# Altium project A_Board_Weather.Station.PrjPcb (part 1 of 2)
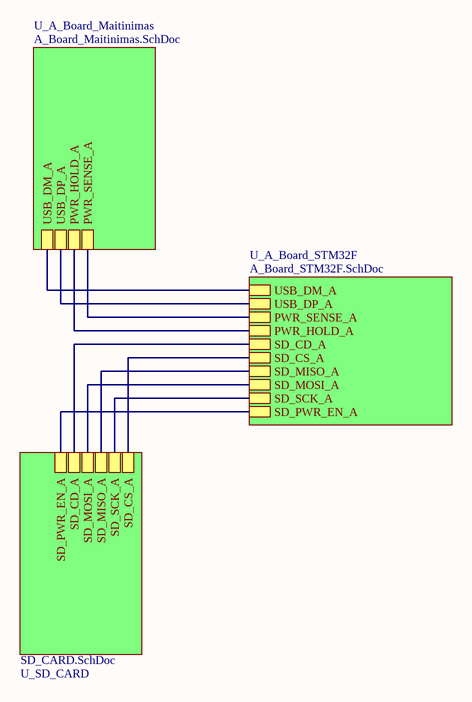
[diagram p0: A_top.SchDoc]
4 sheets, 136 parts. Net scope: hierarchical (ports join the sheet entries above them; power ports are global).
Sheets:
  A_top.SchDoc
    U_A_Board_Maitinimas = A_Board_Maitinimas.SchDoc
    U_A_Board_STM32F = A_Board_STM32F.SchDoc
    U_SD_CARD = SD_CARD.SchDoc

## Sheet A_top.SchDoc
size A4; SheetNumber: 1; SheetTotal: 4

### Sub-sheets
U_A_Board_Maitinimas = A_Board_Maitinimas.SchDoc: USB_DM_A, USB_DP_A, PWR_HOLD_A, PWR_SENSE_A
U_A_Board_STM32F = A_Board_STM32F.SchDoc: USB_DM_A, USB_DP_A, PWR_SENSE_A, PWR_HOLD_A, SD_CD_A, SD_CS_A, SD_MISO_A, SD_MOSI_A, SD_SCK_A, SD_PWR_EN_A
U_SD_CARD = SD_CARD.SchDoc: SD_CS_A, SD_SCK_A, SD_MISO_A, SD_MOSI_A, SD_CD_A, SD_PWR_EN_A

### Nets
PWR_HOLD_A: sheet U_A_Board_Maitinimas/PWR_HOLD_A, sheet U_A_Board_STM32F/PWR_HOLD_A
PWR_SENSE_A: sheet U_A_Board_Maitinimas/PWR_SENSE_A, sheet U_A_Board_STM32F/PWR_SENSE_A
SD_CD_A: sheet U_A_Board_STM32F/SD_CD_A, sheet U_SD_CARD/SD_CD_A
SD_CS_A: sheet U_A_Board_STM32F/SD_CS_A, sheet U_SD_CARD/SD_CS_A
SD_MISO_A: sheet U_A_Board_STM32F/SD_MISO_A, sheet U_SD_CARD/SD_MISO_A
SD_MOSI_A: sheet U_A_Board_STM32F/SD_MOSI_A, sheet U_SD_CARD/SD_MOSI_A
SD_PWR_EN_A: sheet U_A_Board_STM32F/SD_PWR_EN_A, sheet U_SD_CARD/SD_PWR_EN_A
SD_SCK_A: sheet U_A_Board_STM32F/SD_SCK_A, sheet U_SD_CARD/SD_SCK_A
NetIC3_4: sheet U_A_Board_Maitinimas/USB_DM_A, sheet U_A_Board_STM32F/USB_DM_A
NetIC3_6: sheet U_A_Board_Maitinimas/USB_DP_A, sheet U_A_Board_STM32F/USB_DP_A

## Sheet A_Board_Maitinimas.SchDoc
size A3; SheetNumber: 3; SheetTotal: 4
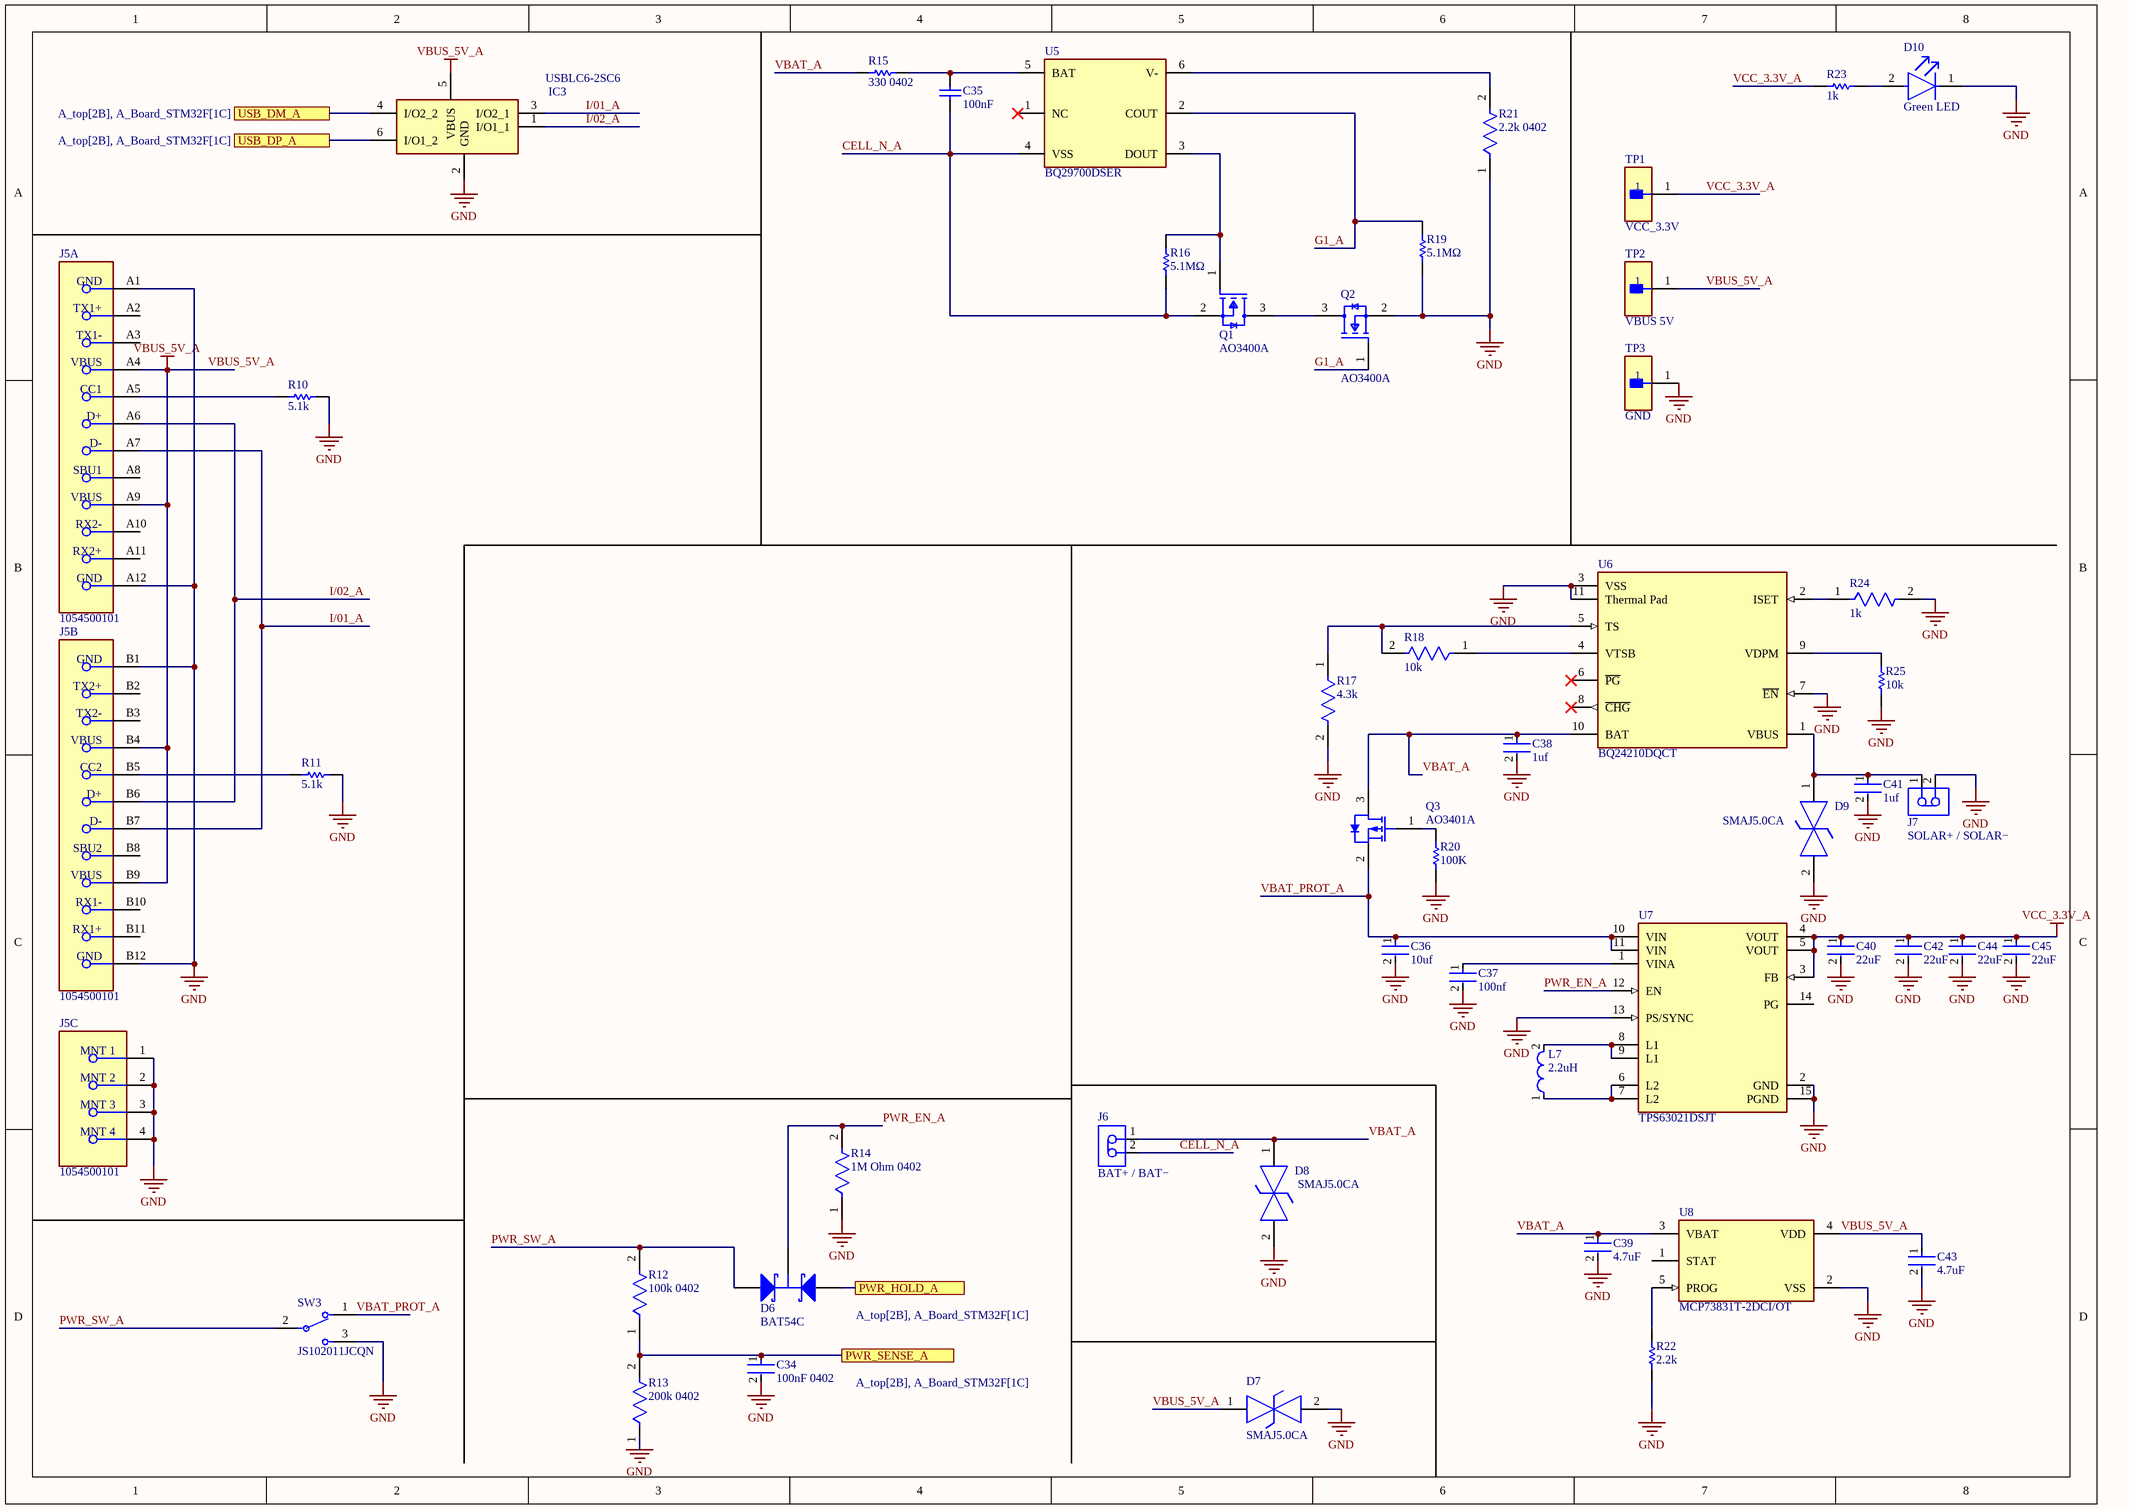
[diagram p1: A_Board_Maitinimas.SchDoc]

### Parts
C34  100nF 0402  [FP-CL17-IPC_C]
C35  100nF  [CAPC1608X90X35NL15T15]
C36  10uf  [FP-CL05A106MP5NUNC-MFG]
C37  100nf  [FP-0402B104K500CT-IPC_C]
C38  1uf  [FP-CL858-IPC_C]
C39  4.7uF  [FP-CL21-IPC_A]
C40  22uF  [FP-GRM21B-0_15-IPC_C]
C41  1uf  [FP-CL858-IPC_C]
C42  22uF  [FP-GRM21B-0_15-IPC_C]
C43  4.7uF  [FP-CL21-IPC_A]
C44  22uF  [FP-GRM21B-0_15-IPC_C]
C45  22uF  [FP-GRM21B-0_15-IPC_C]
D6  BAT54C  [NXP-SOT23-3_V]
D7  SMAJ5.0CA  [FP-SMAJ-MFG]
D8  SMAJ5.0CA  [FP-SMAJ-MFG]
D9  SMAJ5.0CA  [FP-SMAJ-MFG]
D10  Green LED  [FP-LTST-C171GKT-MFG]
IC3  USBLC6-2SC6  [SOT95P280X145-6N]
J5  1054500101  [FP-1054500101-MFG]  (parts A,B,C of 3)
J6  BAT+ / BAT−  [JST-B2B-PH-K-S_V]
J7  SOLAR+ / SOLAR−  [JST-B2B-PH-K-S_V]
L7  2.2uH  [FP-MLP2016M-MFG]
Q1  AO3400A  [FP-SOT23-MFG]
Q2  AO3400A  [FP-SOT23-MFG]
Q3  AO3401A  [AO-SOT-23-3L_V]
R10  5.1k  [RESC1005X40X25ML10T10]
R11  5.1k  [RESC1005X40X25ML10T10]
R12  100k 0402  [FP-CRGCQ0402-IPC_C]
R13  200k 0402  [FP-CRCW0402-e3-IPC_B]
R14  1M Ohm 0402  [FP-CRGCQ0402-IPC_C]
R15  330 0402  [RESC1005X40X25NL10T10]
R16  5.1MΩ  [RESC1005X40X25ML05T05]
R17  4.3k  [FP-RN73R1E-MFG]
R18  10k  [FP-AC0603-IPC_A]
R19  5.1MΩ  [RESC1005X40X25ML05T05]
R20  100K  [RESC1812(4532)_L]
R21  2.2k 0402  [FP-ESR01-IPC_B]
R22  2.2k  [RESC1005X40X25NL10T10]
R23  1k  [RESC1005X40X25ML10T10]
R24  1k  [FP-TFCR0805-MFG]
R25  10k  [RESC3225X60X45NL20T20]
SW3  JS102011JCQN  [FP-JS102011JCQN-MFG]
TP1  VCC_3.3V  [FP-5015-MFG]
TP2  VBUS 5V  [FP-5015-MFG]
TP3  GND  [FP-5015-MFG]
U5  BQ29700DSER  [FP-DSE0006A-IPC_B]
U6  BQ24210DQCT  [FP-DQC0010A-MFG]
U7  TPS63021DSJT  [FP-DSJ0014A-MFG]
U8  MCP73831T-2DCI/OT  [FP-C04-091-OT-IPC_B]

### Ports
PWR_HOLD_A (see A_top[2B], A_Board_STM32F[1C]), PWR_SENSE_A (see A_top[2B], A_Board_STM32F[1C]), USB_DM_A (see A_top[2B], A_Board_STM32F[1C]), USB_DP_A (see A_top[2B], A_Board_STM32F[1C])

### Nets
GND: C34.2 C36.2 C37.2 C38.2 C39.2 C40.2 C41.2 C42.2 C43.2 C44.2 C45.2 D7.2 D8.2 D9.2 D10.1(C) IC3.2(GND) J5.1(MNT_1) J5.2(MNT_2) J5.3(MNT_3) J5.4(MNT_4) J5.A1(GND) J5.A12(GND) J5.B1(GND) J5.B12(GND) J7.2 Q2.2(S) R10.2 R11.2 R13.1 R14.1 R17.2 R19.1 R20.2 R21.1 R22.1 R24.2 R25.1 SW3.3 TP3.1 U6.3(VSS) U6.7(~{EN}) U6.11(Thermal_Pad) U7.2(GND) U7.13(PS/SYNC) U7.15(PGND) U8.2(VSS)
VBUS_5V_A: C43.1 D7.1 IC3.5(VBUS) J5.A4(VBUS) J5.A9(VBUS) J5.B4(VBUS) J5.B9(VBUS) TP2.1 U8.4(VDD)
VCC_3.3V_A: C40.1 C42.1 C44.1 C45.1 R23.1 TP1.1 U7.3(FB) U7.4(VOUT) U7.5(VOUT)
CELL_N_A: C35.1 J6.2 Q1.2(S) R16.1 U5.4(VSS)
G1_A: Q2.1(G) R19.2 U5.2(COUT)
I/01_A: IC3.3(I/O2_1) J5.A7(D-) J5.B7(D-)
I/02_A: IC3.1(I/O1_1) J5.A6(D+) J5.B6(D+)
PWR_EN_A: D6.3(K) R14.2 U7.12(EN)
PWR_HOLD_A: D6.2(A) ; port PWR_HOLD_A
PWR_SENSE_A: C34.1 R12.1 R13.2 ; port PWR_SENSE_A
PWR_SW_A: D6.1(A) R12.2 SW3.2
VBAT_A: C38.1 C39.1 D8.1 J6.1 Q3.3(DRAIN) R15.1 U6.10(BAT) U8.3(VBAT)
VBAT_PROT_A: C36.1 Q3.2(SOURCE) SW3.1 U7.10(VIN) U7.11(VIN)
NetC35_2: C35.2 R15.2 U5.5(BAT)
NetC37_1: C37.1 U7.1(VINA)
NetC41_1: C41.1 D9.1 J7.1 U6.1(VBUS)
NetD10_2: D10.2(A) R23.2
NetIC3_4: IC3.4(I/O2_2) ; port USB_DM_A
NetIC3_6: IC3.6(I/O1_2) ; port USB_DP_A
NetJ5_A5: J5.A5(CC1) R10.1
NetJ5_B5: J5.B5(CC2) R11.1
NetL7_1: L7.1 U7.6(L2) U7.7(L2)
NetL7_2: L7.2 U7.8(L1) U7.9(L1)
NetQ1_1: Q1.1(G) R16.2 U5.3(DOUT)
NetQ1_3: Q1.3(D) Q2.3(D)
NetQ3_1: Q3.1(GATE) R20.1
NetR17_1: R17.1 R18.2 U6.5(TS)
NetR18_1: R18.1 U6.4(VTSB)
NetR21_2: R21.2 U5.6(V-)
NetR22_2: R22.2 U8.5(PROG)
NetR24_1: R24.1 U6.2(ISET)
NetR25_2: R25.2 U6.9(VDPM)

Not connected (* = marked no-connect by the designer): J5 A2(TX1+) A3(TX1-) A8(SBU1) A10(RX2-) A11(RX2+) B2(TX2+) B3(TX2-) B8(SBU2) B10(RX1-) B11(RX1+); U5 1(NC)*; U6 6(~{PG})* 8(~{CHG})*; U7 14(PG); U8 1(STAT)

### Library data of the parts
C34 = CMP-13271-001069-1: Cap Ceramic 100nF 10V X7R ±10% SMD 0402 +125°C Paper T/R; Height: 0.5mm; Case/Package: 0402; Contact Plating: Tin; Case Code (Imperial): 0402; Capacitance: 100nF; Thickness: 0.022inch; Min Operating Temperature: -55°C; Package Quantity: 1; Length: 1mm; Max Operating Temperature: 125°C; Depth: 0.5mm; Voltage Rating: 10V; Packaging: Tape and Reel; Mount: Surface Mount; Tolerance: 10%; Width: 0.02inch; Radiation Hardening: No; Case Code (Metric): 1005; Dielectric: X7R
C35 = CMP-2006-02299-1: Part Number: C0603C104K4RAC7013; Manufacturer: Kemet
C36 = CMP-13271-000002-1: CAP CER 10UF 10V X5R 0402; Manufacturer Part Number: CL05A106MP5NUNC; Manufacturer: Samsung; Temperature Coefficient: 15%; Tolerance: 20%; Material: Ceramic; Octopart: https://octopart.com/cl05a106mp5nunc-samsung-22457395; Voltage Rating: 10V; RoHS: TRUE; Value: 10uF; Height: 0.7mm; Digikey Description: CAP CER 10UF 10V X5R 0402; Automotive: No; Package: CL05A106MP5NUNC; Device Class L1: Passive Components; Capacitance: 10uF; Temperature Range High: +85°C; ComponentLink2Description: Datasheet; Device Class L2: Capacitors; Temperature Characteristic: X5R; Temperature: -55°C to +85°C; ComponentLink2URL: http://www.samsungsem.com/kr/support/product-search/mlcc/__icsFiles/afieldfile/2019/05/10/19-CL05A106MP5NUNC.pdf; Device Class L3: Ceramic Capacitors; Category: Cap; Temperature Range Low: -55°C; Ipc Land Pattern Name: CAPC10050X50; Lead Free: Yes
C37 = CMP-45632-000010-1: CAP CER 0.1UF 50V X7R 0402; Tolerance: 10%; Max Operating Temperature: 125°C; Case Code (Metric): 1005; RoHS Compliant: Yes; Series: -; Case Code (Imperial): 0402; Voltage Rating: 50V; Min Operating Temperature: -55°C; Mount: Surface Mount; Capacitance: 100nF; Case/Package: 0402; Packaging: Cut Tape
C38 C41 = CMP-13271-003231-1: Cap Ceramic 1uF 6.3V X6S ±10% SMD 0402 +105°C Paper T/R; Mount: Surface Mount; Voltage Rating: 6.3V; Min Operating Temperature: -55°C; Case/Package: 0402; Thickness: 0.022inch; Radiation Hardening: No; Capacitance: 1uF; Contact Plating: Tin; Max Operating Temperature: 105°C; Length: 1mm; Tolerance: 10%; Dielectric: X6S; Height: 0.5mm; Depth: 0.5mm; Case Code (Imperial): 0402; Package Quantity: 1; Width: 0.02inch; Case Code (Metric): 1005; Packaging: Tape and Reel
C39 C43 = CMP-13271-002624-1: CL21 Series 0805 4.7uF 25V ±10% Tolerance X5R Multilayer Ceramic Chip Capacitor; Case Code (Imperial): 0805; Thickness: 0.055inch; Mount: Surface Mount; Case Code (Metric): 2012; Capacitance: 4.7uF; Depth: 1.25mm; Lead Free: Lead Free; Case/Package: 0805; Voltage Rating: 25V; Package Quantity: 1; Width: 0.049inch; Radiation Hardening: No; Voltage Rating (DC): 25V; Length: 2mm; Dielectric: X5R; Height: 1.25mm; Packaging: Tape and Reel; Tolerance: 10%; Min Operating Temperature: -55°C; Max Operating Temperature: 85°C
C40 C42 C44 C45 = CMP-06035-052350-1: Chip Multilayer Ceramic Capacitors for General Purpose, 0805, 22uF, X5R, 15%, 20%, 10V; Tolerance: 20%; Capacitance: 22uF; Dielectric: X5R; Width: 1.25mm; Voltage Rating (DC): 10V; Length: 2mm; Thickness: 1.25mm; Case/Package: 0805
D6 = CMP-0417-00003-1: Schottky Barrier Diode, 30 V, 2 uA, -55 to 150 degC, 3-Pin SOT23, RoHS, Tape and Reel; Manufacturer: NXP Semiconductors; IR (uA): 2; VF (mV): 800; Trr (ns): 5; Cd (pF): 10; VR (V): 30; Rth(j-a) (K/W): 500; RoHS: TRUE; Packing: Tape and Reel; ComponentLink2URL: http://www.nxp.com/documents/data_sheet/BAT54_SER.pdf; PartNumber: BAT54C; ComponentLink2Description: Datasheet; Temperature Range: -55 to 150 degC; PackageReference: SOT23-3; PackageDescription: 3-Pin Plastic Surface-mounted Package, Body 1.3 x 2.9 mm, Pitch 0.95 mm; Mounting Technology: Surface Mount; ComponentLink1URL: http://www.nxp.com/; DatasheetVersion: Rev. 5; ComponentLink1Description: Manufacturer URL
D7-D9 = CMP-2000-07091-2: TVS DIODE 5V 9.2V SMA; Manufacturer: Bourns Inc.; Direction: Bidirectional; Standoff Height: 0.05mm; Breakdown Voltage: 6.4V; Number Of Channels: 1; Max Junction Temp: +150°C; Peak Pulse Power: 400W; Lead Free: Yes; Digikey Description: TVS DIODE 5V 9.2V SMA; Automotive: No; Temperature: -55°C to +150°C; Package: SMAJ; Temperature Range Low: -55°C; Octopart: https://octopart.com/smaj5.0ca-bourns-12809390; Device Class L2: TVS Diodes; Device Class L3: unset; ComponentLink2URL: https://bourns.com/data/global/pdfs/SMAJ.pdf; RoHS: TRUE; ComponentLink2Description: Datasheet; Mouser Description: TVS Diodes - Transient Voltage Suppressors 5volts 800/1600uA 43.5 Amps Bi-Dir; Reverse Standoff Voltage: 5V; Temperature Range High: +150°C; Height: 2.62mm; Manufacturer Part Number: SMAJ5.0CA; Category: Diode; Device Class L1: Circuit Protection
D10 = CMP-22017-000007-1: LED GREEN CLEAR CHIP SMD; Luminous Intensity: 12mcd; Lens Color: Colorless; Dominant Wavelength: 569nm; Number of LEDs: 1; Power Dissipation: 100mW; Viewing Angle: 130°; Reverse Voltage: 5V; Test Current: 10mA; Forward Voltage: 2.1V; Wavelength: 585nm; Lens Style: Diffused; Forward Current: 30mA; Height: 0.8mm; Mount: Surface Mount; Package Quantity: 1; Length: 2mm; Case Code (Metric): 2012; Number of Pins: 2; Number of Elements: 1; Packaging: Tape and Reel; Color: Green; Min Operating Temperature: -55°C; Case/Package: 0805; Power Rating: 100mW; Max Operating Temperature: 85°C; Radiation Hardening: No; Depth: 1.25mm; Lens Transparency: Clear; Width: 1.25mm; Lead Free: Lead Free; Case Code (Imperial): 0805; Illumination Color: Green
IC3 = USBLC6-2SC6: Integrated Circuit; Manufacturer_Name: STMicroelectronics; Datasheet Link: https://www.st.com/resource/en/datasheet/usblc6-2.pdf; Height: 1.45mm; Manufacturer_Part_Number: USBLC6-2SC6; Mouser Part Number: 511-USBLC6-2SC6; Mouser Price/Stock: https://www.mouser.co.uk/ProductDetail/STMicroelectronics/USBLC6-2SC6?qs=po45yt2pPpu%2FhNIlwQdTlg%3D%3D; Arrow Part Number: USBLC6-2SC6; Arrow Price/Stock: https://www.arrow.com/en/products/usblc6-2sc6/stmicroelectronics.html?utm_currency=USD&region=asia
J5 = CMP-04767-000004-1: CONN RCP USB3.1 TYPEC 24P SMD RA; Manufacturer: Molex; Number Of Contacts: 24; Voltage Rating: 30V; Shielding: true; Is Female: yes; Current Rating: 0.25/1.25/5A; Pitch: 0.5mm; Conn Orientation: Right Angle; Package: 0; Height: 3.44mm; Footprint Url: https://www.molex.com/pdm_docs/sd/1054500101_sd.pdf; Device Class L1: Connectors; Category: Conn; Device Class L2: USB Connectors; Digikey Description: CONN RCP USB3.1 TYPEC 24P SMD RA; Contact Material: Gold,Nickel; Mouser Description: USB Shielded I/O Receptacle; Type C; Right Angle; Surface Mount; Gold over Nickel; ComponentLink2Description: Datasheet; Lead Free: Yes; Automotive: No; Temperature Range High: +85°C; RoHS: TRUE; Octopart: https://octopart.com/105450-0101-molex-68082325; ComponentLink2URL: https://www.molex.com/webdocs/datasheets/pdf/en-us/1054500101_IO_CONNECTORS.pdf; Temperature: -30°C to +85°C; Usb Standard: USB 3.1; Temperature Range Low: -30°C; Device Class L3: unset; Manufacturer Part Number: 1054500101
J6 J7 = CMP-2000-05162-1: Male Header, Pitch 2 mm, 1 x 2 Position, Height 6 mm, Tail Length 3.4 mm, -25 to 85 degC, RoHS, Bulk; Manufacturer: JST; Pitch: 2mm; Style/Orientation: StraightHeader/Plug; No of Positions: 2; Datasheet Version: Nov-08; Datasheet URL: http://datasheet.octopart.com/B2B-PH-K-S%28LF%29%28SN%29-JST-datasheet-8324864.pdf; Manufacturer URL: http://www.jst.com/home2.html; Type: ShroudedHeader; Termination: Crimp
L7 = CMP-08253-000274-1: Shielded Multilayer Inductor 2.2uH ±20% 1200mA 137.5mΩ SMD 0806; DC Resistance (DCR): 137.5mR; Current Rating: 1.2A; Test Frequency: 2MHz; Core Material: Ferrite; Shielding: Unshielded; Mount: Surface Mount; Max Operating Temperature: 125°C; Packaging: Tape and Reel; Lead Free: Lead Free; Height - Seated (Max): 0.039inch; Length: 0.079inch; Case/Package: 0806; Case Code (Metric): 2016; Case Code (Imperial): 0806; Inductance: 2.2uH; RoHS Compliant: Yes; Width: 0.063inch; Package Quantity: 3000; Tolerance: 20%; Min Operating Temperature: -40°C
Q1 Q2 = CMP-83955-000006-1: MOSFET N-CH 30V 5.7A SOT23; Input Capacitance: 630pF; Number of Elements: 1; Rds On Max: 26.5mR; Max Power Dissipation: 1.4W; Gate to Source Voltage (Vgs): 12V; Min Operating Temperature: -55°C; Lead Free: Lead Free; Number of Pins: 3; Drain to Source Voltage (Vdss): 30V; Case/Package: SOT-23; Mount: Surface Mount; Continuous Drain Current (ID): 5.7A; Radiation Hardening: No; Packaging: Tape and Reel; Max Operating Temperature: 150°C; Power Dissipation: 1.4W
Q3 = CMP-2000-05778-1: P-Channel MOSFET, 30 V, 4 A, -55 to 150 degC, 3-Pin SOT-23-3L, RoHS, Tape and Reel; Manufacturer: Alpha and Omega; Output Power (Max): NotRequiredW; Power Dissipation: 1.4W; Rad Hardened: No; Drain Efficiency: NotRequired%; Drain-Source On-Volt: 30V; Noise Figure: NotRequireddB; Frequency (Max): NotRequiredMHz; Number of  Elements: 1; Gate-Source Voltage (Max): ?12V; Drain Current (Max): 4A; Channel Mode: Enhancement; Drain-Source On-Res: 0.044ohm; Type: PowerMOSFET; Polarity: P; Package URL: http://www.aosmd.com/res/packaging_information/SOT-23-3L.pdf; Datasheet URL: http://www.aosmd.com/res/data_sheets/AO3401A.pdf; Package Type: SOT-23; Package Description: 3-Pin Small Outline Transistor, Body 2.95 x 1.6 mm, Pitch 0.95 mm; Mounting: SurfaceMount; Manufacturer URL: http://www.aosmd.com/; Continuous Drain Current: 4A; Package Reference: SOT-23-3L; Mounting Technology: SurfaceMount; Operating Temperature Classification: Military; Power Gain: NotRequireddB; Datasheet Version: Rev. 3, 03/2011; Operating Temp Range: -55Cto150C; Pin Count: 3
R10 R11 = CMP-2002-04046-1: Manufacturer: KOA Speer; Part Number: RK73H1ETTP5101F
R12 = CMP-03211-001412-1: CRGCQ0402 100KΩ 1% ±100ppm/°C 50V; Manufacturer Part Number: CRGCQ0402F100K; Manufacturer: TE Connectivity; Tolerance: 0.01; Power Rating: 0.0625W; Resistance: 100KΩ; Ambient Temperature Range High: +70°C; Series: CRGCQ; Temperature: -55°C to +155°C; Temperature Range Low: -55°C; ComponentLink2Description: Datasheet; Category: Res; Temperature Range High: +155°C; Automotive: Yes; Device Class L2: Resistors; Height: 0.4mm; Ipc Land Pattern Name: RESC10050X35; Voltage Rating: 50V; ComponentLink2URL: https://www.te.com/commerce/DocumentDelivery/DDEController?Action=showdoc&DocId=Data+Sheet%7F1773204-3%7F1%7Fpdf%7FEnglish%7FENG_DS_1773204-3_1.pdf%7F4-2176347-1150; Composition: Thick Film; Device Class L1: Passive Components; Device Class L3: Chip SMD Resistors; RoHS: TRUE; Temperature Coefficient: ±100ppm/°C; Lead Free: Yes; Value: 100KΩ; Octopart: https://octopart.com/crgcq0402f100k-te+connectivity-91017930; Package: CRGCQ0402
R13 = CMP-02407-008260-1: RES Thick Film, 200kΩ, 1%, 0.063W, 100ppm/°C, 0402
R14 = CMP-03211-005885-1: Res Thick Film 0402 1M Ohm 1% 0.063W(1/16W) ±100ppm/C Pad SMD Automotive T/R; Manufacturer: TE Connectivity; Manufacturer Part Number: CRGCQ0402F1M0; Power Rating: 0.0625W; Tolerance: 0.01; Resistance: 1MΩ; Voltage Rating: 50V; Value: 1MΩ; Temperature Coefficient: ±100ppm/°C; Series: CRGCQ; Digikey Description: Res Thick Film 0402 1M Ohm 1% 0.063W(1/16W) ±100ppm/C Pad SMD Automotive T/R; Automotive: Yes; ComponentLink2URL: https://www.te.com/commerce/DocumentDelivery/DDEController?Action=showdoc&DocId=Data+Sheet%7F1773204-3%7F1%7Fpdf%7FEnglish%7FENG_DS_1773204-3_1.pdf%7F4-2176347-1378; Ipc Land Pattern Name: RESC10050X35; Category: Res; ComponentLink2Description: Datasheet; Temperature Range High: +155°C; Temperature Range Low: -55°C; Device Class L3: Chip SMD Resistors; RoHS: TRUE; Lead Free: Yes; Octopart: https://octopart.com/crgcq0402f1m0-te+connectivity-91017950; Ambient Temperature Range High: +70°C; Package: CRGCQ0402; Mouser Description: Res Thick Film 0402 1M Ohm 1% 0.063W(1/16W) ±100ppm/C Pad SMD Automotive T/R; Device Class L1: Passive Components; Temperature: -55°C to +155°C; Composition: Thick Film; Device Class L2: Resistors; Height: 0.4mm
R15 = CMP-1011-00454-2: Part Number: CR0402-FX-3300GLF; Manufacturer: Bourns
R16 R19 = CMP-1011-00163-2: Part Number: ERJ-2GEJ515X; Manufacturer: Panasonic
R17 = CMP-04015-046329-1: 4.3kΩ ±1% 0.063W, 1/16W Chip Resistor 0402 (1005 Metric) Moisture Resistant Thin Film
R18 = CMP-03412-040683-1: RES 10kΩ 5.00% 0.2W 0603
R20 = CMP-1016-00715-1: 100K 0.75W 1% 1812 (4532 Metric)  SMD; Case-EIA: 1812; Value: 100000.00 Ohm; Case-Metric: 4532; Technology: SMT; Power: 0.75 W; Tolerance: 1 %
R21 = CMP-08839-005908-1: 2.2kΩ ±1% 0.2W 0402 Anti-Surge Chip Resistor AEC-Q200; RoHS Compliant: Yes
R22 = CMP-2002-03812-1: Manufacturer: KOA Speer; Part Number: RK73H1ETTP2201F
R23 = CMP-2002-04581-1: Manufacturer: KOA Speer; Part Number: SG73P1ETTP1001F
R24 = CMP-250906-230108-1: RES Thin Film,  620Ω, 0.1%, 0.125W, 50ppm/°C, 0805
R25 = CMP-2005-01993-1: Part Number: CRCW121010K0FKEA; Manufacturer: Vishay Dale
SW3 = CMP-10038-000010-1: SWITCH SLIDE SPDT 300MA 6V; Electrical Life: 5000Cycles; Switch Function: On-On; Actuator Material: Nylon; Actuator Length: 2mm; Actuator Type: Standard; Current Rating: 300mA; Voltage Rating (DC): 6V; Min Operating Temperature: -40°C; Throw Configuration: SPDT; Mount: Surface Mount; Switch Travel: 2mm; Max Operating Temperature: 85°C; Packaging: Cut Tape; Contact Plating: Silver; Contact Material: Copper Alloy
TP1-TP3 = CMP-2000-05183-2: PC TEST POINT MINIATURE; Manufacturer Part Number: 5015; Manufacturer: keystone; Number Of Contacts: 1; Conn Orientation: Straight; Category: Conn; Digikey Description: PC TEST POINT MINIATURE; Automotive: No; Lead Free: Yes; Octopart: https://octopart.com/5015-keystone-3822; ComponentLink2URL: http://www.keyelco.com/product-pdf.cfm?p=1353; Package: 5015; RoHS: TRUE; Device Class L3: unset; Device Class L2: unset; Contact Material: Silver; Device Class L1: Connectors; Height: 1.65mm; ComponentLink2Description: Datasheet
U5 = CMP-04911-000043-1: IC LITHIUM BATT PROTECT 6-SON; Number of Cells: 1; Fault Protection: Over Current; Operating Supply Voltage: 8V; Packaging: Tape and Reel; RoHS Compliant: Yes; Contact Plating: Gold; Lead Free: Lead Free; Min Operating Temperature: -40°C; Number of Pins: 6; Max Operating Temperature: 85°C; Package Quantity: 3000; Mount: Surface Mount; Weight: 0.000342oz
U6 = CMP-0321-00481-3: IC BATT CHARGER LI-ION 10WSON; Battery Type: LITHIUM-ION; Max Output Current: 1.25A; Max Charge Current: 800mA; Output Voltage: 4.2V; Min Supply Voltage: 4V; Min Input Voltage: 3.5V; Max Supply Voltage: 6.5V; Number of Cells: 1; Length: 3.1mm; Case/Package: SON; Height: 0.75mm; Max Operating Temperature: 85°C; Contact Plating: Gold; Package Quantity: 1; RoHS Compliant: Yes; Radiation Hardening: No; Number of Pins: 10; Min Operating Temperature: -40°C; Width: 2.1mm; REACH SVHC: No SVHC; Series: -; Packaging: Tape and Reel; Operating Supply Current: 800mA; Lead Free: Lead Free; Output Current: 800mA
U7 = CMP-04918-000699-1: IC REG BCK BST 3.3V 3.5A 14VSON; Output Type: Fixed; Output Current: 3A; Switching Frequency: 2.4MHz; Operating Supply Voltage: 5.5V; Supply Current: 50uA; Number of Outputs: 1; Topology: Buck-Boost; Efficiency: 96%; Output Configuration: Positive; Min Input Voltage: 1.8V; Synchronous Rectifier: Yes; Output Voltage: 3.3V; Package Quantity: 250; Case/Package: VSON; Max Input Voltage: 5.5V; Quiescent Current: 50uA; Nominal Supply Current: 50uA; Min Output Voltage: 3.3V; Number of Pins: 14; Lead Free: Lead Free; Max Operating Temperature: 85°C; Mount: Surface Mount; Max Output Current: 3A; Radiation Hardening: No; Series: -; Min Operating Temperature: -40°C; Packaging: Tape and Reel; RoHS Compliant: Yes; Min Supply Voltage: 1.8V
U8 = CMP-0133-00146-2: IC CONTROLLR LI-ION 4.2V SOT23-5; Max Charge Current: 500mA; Min Output Voltage: 4.168V; Max Supply Voltage: 6V; Max Output Voltage: 4.232V; Number of Cells: 1; Operating Supply Current: 510uA; Min Supply Voltage: 3.75V; Max Output Current: 500mA; Case/Package: SOT-23; Radiation Hardening: No; REACH SVHC: No SVHC; Package Quantity: 3000; Output Current: 500mA; Number of Channels: 1; Output Voltage: 4.2V; Max Operating Temperature: 85°C; Number of Pins: 5; Mount: Surface Mount; Length: 3.1mm; Contact Plating: Tin; Packaging: Tape and Reel; Width: 1.8mm; Min Operating Temperature: -40°C; Max Input Voltage: 3.75V; Height: 1.3mm; Lead Free: Lead Free